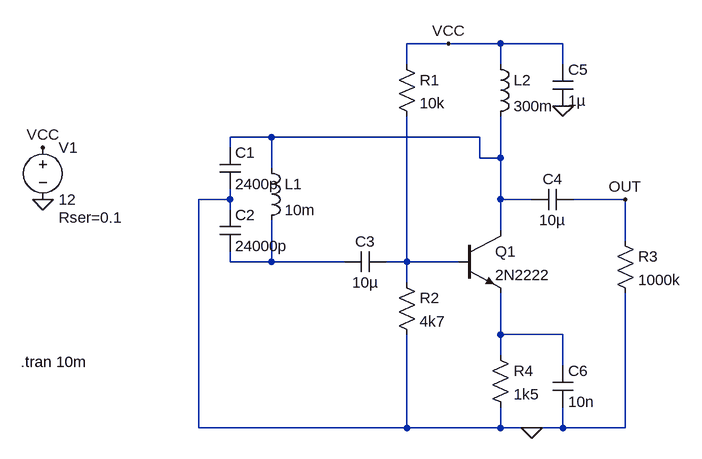
[diagram p0: schematic oscillator_colpitts.asc]
oscillator_colpitts.asc, the LTspice schematic file:
Version 4
SHEET 1 880 680
WIRE 256 -48 192 -48
WIRE 336 -48 256 -48
WIRE 432 -48 336 -48
WIRE 192 -16 192 -48
WIRE 336 -16 336 -48
WIRE 432 -16 432 -48
WIRE -16 96 -80 96
WIRE 304 96 -16 96
WIRE -80 112 -80 96
WIRE 304 128 304 96
WIRE 336 128 336 64
WIRE 336 128 304 128
WIRE -16 144 -16 96
WIRE -80 192 -80 176
WIRE -80 192 -128 192
WIRE 336 192 336 128
WIRE 384 192 336 192
WIRE 528 192 448 192
WIRE -80 208 -80 192
WIRE 336 240 336 192
WIRE 528 256 528 192
WIRE -80 288 -80 272
WIRE -16 288 -16 224
WIRE -16 288 -80 288
WIRE 96 288 -16 288
WIRE 192 288 192 64
WIRE 192 288 160 288
WIRE 272 288 192 288
WIRE 192 320 192 288
WIRE 336 400 336 336
WIRE 432 400 336 400
WIRE 336 432 336 400
WIRE 432 448 432 400
WIRE -128 544 -128 192
WIRE 192 544 192 400
WIRE 192 544 -128 544
WIRE 336 544 336 512
WIRE 336 544 192 544
WIRE 384 544 336 544
WIRE 432 544 432 512
WIRE 432 544 384 544
WIRE 528 544 528 336
WIRE 528 544 432 544
FLAG -368 192 0
FLAG -368 112 VCC
FLAG 432 48 0
FLAG 256 -48 VCC
FLAG 528 192 OUT
FLAG 384 544 0
SYMBOL ind -32 128 R0
SYMATTR InstName L1
SYMATTR Value 10m
SYMATTR SpiceLine Ipk=0.1 Rser=10 Rpar=4.03384e+006 Cpar=0
SYMBOL cap -96 112 R0
SYMATTR InstName C1
SYMATTR Value 2400p
SYMATTR SpiceLine V=25 Irms=0 Rser=0 Lser=0
SYMBOL cap -96 208 R0
SYMATTR InstName C2
SYMATTR Value 24000p
SYMATTR SpiceLine V=25 Irms=0 Rser=0 Lser=0
SYMBOL cap 160 272 R90
WINDOW 0 0 32 VBottom 2
WINDOW 3 32 32 VTop 2
SYMATTR InstName C3
SYMATTR Value 10µ
SYMATTR SpiceLine V=25 Irms=0 Rser=0.001 Lser=0
SYMBOL cap 448 176 R90
WINDOW 0 0 32 VBottom 2
WINDOW 3 32 32 VTop 2
SYMATTR InstName C4
SYMATTR Value 10µ
SYMATTR SpiceLine V=25 Irms=0 Rser=0.001 Lser=0
SYMBOL res 176 -32 R0
SYMATTR InstName R1
SYMATTR Value 10k
SYMBOL res 176 304 R0
SYMATTR InstName R2
SYMATTR Value 4k7
SYMBOL res 512 240 R0
SYMATTR InstName R3
SYMATTR Value 1000k
SYMBOL ind 320 -32 R0
SYMATTR InstName L2
SYMATTR Value 300m
SYMATTR SpiceLine Ipk=0.099 Rser=61.662 Rpar=9.42e+006 Cpar=0
SYMBOL npn 272 240 R0
SYMATTR InstName Q1
SYMATTR Value 2N2222
SYMBOL voltage -368 96 R0
WINDOW 123 0 0 Left 0
WINDOW 39 24 124 Left 2
SYMATTR InstName V1
SYMATTR Value 12
SYMATTR SpiceLine Rser=0.1
SYMBOL cap 416 -16 R0
SYMATTR InstName C5
SYMATTR Value 1µ
SYMATTR SpiceLine V=25 Irms=0 Rser=0.007 Lser=0 mfg="TDK" pn="C3216X7RIE105M" type="X7R"
SYMBOL res 320 416 R0
SYMATTR InstName R4
SYMATTR Value 1k5
SYMBOL cap 416 448 R0
SYMATTR InstName C6
SYMATTR Value 10n
TEXT -402 442 Left 2 !.tran 10m

The netlist it stands for:
* oscillator_colpitts.asc
L1 N001 N002 10m Ipk=0.1 Rser=10 Rpar=4.03384e+006 Cpar=0
C1 N001 0 2400p V=25 Irms=0 Rser=0 Lser=0
C2 0 N002 24000p V=25 Irms=0 Rser=0 Lser=0
C3 N003 N002 10µ V=25 Irms=0 Rser=0.001 Lser=0
C4 OUT N001 10µ V=25 Irms=0 Rser=0.001 Lser=0
R1 VCC N003 10k
R2 N003 0 4k7
R3 OUT 0 1000k
L2 VCC N001 300m Ipk=0.099 Rser=61.662 Rpar=9.42e+006 Cpar=0
Q1 N001 N003 N004 0 2N2222
V1 VCC 0 12 Rser=0.1
C5 VCC 0 1µ V=25 Irms=0 Rser=0.007 Lser=0 mfg="TDK" pn="C3216X7RIE105M" type="X7R"
R4 N004 0 1k5
C6 N004 0 10n
.model NPN NPN
.model PNP PNP
.lib standard.bjt
.tran 10m
.backanno
.end